# Altium project 03_PCB_Project_03.PrjPcb
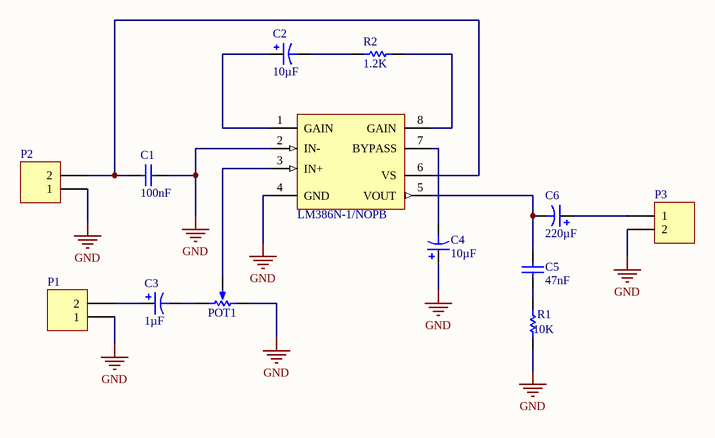
[diagram p0: Sheet1.SchDoc]
1 sheet, 13 parts. Net scope: global (net labels, ports and power ports of the same name join across sheets).
Board file: PCB1.pcbdoc

## Sheet Sheet1.SchDoc
size A; SheetNumber: 1; SheetTotal: 1

### Parts
C1  value 100nF  [RAD-0.3]  (hidden comment: Cap)
C2  value 10µF  [RB7.6-15]  (hidden comment: Cap Pol1)
C3  value 1µF  [RB7.6-15]  (hidden comment: Cap Pol1)
C4  value 10µF  [RB7.6-15]  (hidden comment: Cap Pol1)
C5  value 47nF  [RAD-0.3]  (hidden comment: Cap)
C6  value 220µF  [RB7.6-15]  (hidden comment: Cap Pol1)
P1  Header 2  [HDR1X2]  (value not drawn)
P2  Header 2  [HDR1X2]  (value not drawn)
P3  Header 2  [HDR1X2]  (value not drawn)
POT1  RPot  [VR5]  (value not drawn)
R1  value 10K  [AXIAL-0.3]  (hidden comment: Res1)
R2  value 1.2K  [AXIAL-0.3]  (hidden comment: Res1)
U?  LM386N-1/NOPB  [P0008A]

### Nets
GND: C1.2 C4.1 P1.1 P2.1 P3.2 POT1.1(TOP) R1.1 U?.2(IN-) U?.4(GND)
NetC1_1: C1.1 P2.2 U?.6(VS)
NetC2_1: C2.1 U?.1(GAIN)
NetC2_2: C2.2 R2.1
NetC3_1: C3.1 P1.2
NetC3_2: C3.2 POT1.2(BOT)
NetC4_2: C4.2 U?.7(BYPASS)
NetC5_1: C5.1 R1.2
NetC5_2: C5.2 C6.2 U?.5(VOUT)
NetC6_1: C6.1 P3.1
NetPOT1_3: POT1.3(TAP) U?.3(IN+)
NetR2_2: R2.2 U?.8(GAIN)

### Library data of the parts
C1 C5 = Cap: Capacitor; Published: 8-Jun-2000; LatestRevisionDate: 17-Jul-2002; LatestRevisionNote: Re-released for DXP Platform.; PackageReference: RAD-0.3; Publisher: Altium Limited; PackageDescription: Radial Cap, Thru-Hole; 2 Leads; 0.3 in Pin Spacing
C2-C4 C6 = Cap Pol1: Polarized Capacitor (Radial); Published: 8-Jun-2000; LatestRevisionDate: 17-Jul-2002; LatestRevisionNote: Re-released for DXP Platform.; PackageReference: RB7.6-15; Publisher: Altium Limited; PackageDescription: Polarized Capacitor (Radial); 2 Leads
P1-P3 = Header 2: Header, 2-Pin; LatestRevisionDate: 17-Jul-2002; LatestRevisionNote: Re-released for DXP Platform.; Publisher: Altium Limited
POT1 = RPot: Potentiometer; Sim Note: Enter the Resistance value and the set point into parameter fields.; Set Position: 0.5; Value: 1K; Published: 8-Jun-2000; LatestRevisionDate: 17-Jul-2002; LatestRevisionNote: Re-released for DXP Platform.; PackageReference: VR5; Publisher: Altium Limited; PackageDescription: Variable Resistor, Thru-Hole; 3 Leads
R1 R2 = Res1: Resistor; Published: 8-Jun-2000; LatestRevisionDate: 17-Jul-2002; LatestRevisionNote: Re-released for DXP Platform.; PackageReference: AXIAL-0.3; Publisher: Altium Limited; PackageDescription: Axial Device, Thru-Hole; 2 Leads; 0.3 in Pin Spacing
U? = CMP-0057-00052-4: Low Voltage Audio Power Amplifier, 8-pin MDIP, Pb-Free; Manufacturer: Texas Instruments; PackageTopMarking: NSUZXYTTE#*LM*386N-1; PowerWise: N; CompType: Audio IC; RoHS: Y; PackageReference: P0008A; Code_JEDEC: MS-001-BA; PackageDescription: MDIP, .365 x .250 x .130in, 8 Lead, .100in Pitch; PinCount: 8; ComponentLink1URL: http://www.ti.com/general/docs/lit/getliterature.tsp?genericPartNumber=LM386&fileType=pdf; ComponentLink1Description: Datasheet URL